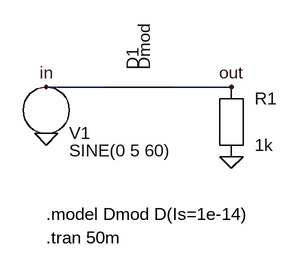
[diagram p0: schematic rectifier_drawn.asc]
rectifier_drawn.asc, the LTspice schematic file:
Version 4
SHEET 1 880 680
WIRE 96 96 176 96
WIRE 272 96 352 96
FLAG 96 96 in
FLAG 352 96 out
FLAG 96 160 0
FLAG 352 192 0
SYMBOL voltage 96 128 R0
SYMATTR InstName V1
SYMATTR Value SINE(0 5 60)
SYMBOL diode 224 96 R270
SYMATTR InstName D1
SYMATTR Value Dmod
SYMBOL res 352 144 R0
SYMATTR InstName R1
SYMATTR Value 1k
TEXT 96 272 Left 2 !.model Dmod D(Is=1e-14)
TEXT 96 304 Left 2 !.tran 50m

The netlist it stands for:
* rectifier_drawn.asc
V1 in 0 SINE(0 5 60)
D1 in out Dmod
R1 out 0 1k
.model D D
.lib standard.dio
.model Dmod D(Is=1e-14)
.tran 50m
.backanno
.end